# Altium schematic sheet ETH.SchDoc
size A3; DocumentNumber: 6; SheetNumber: 6; SheetTotal: 12
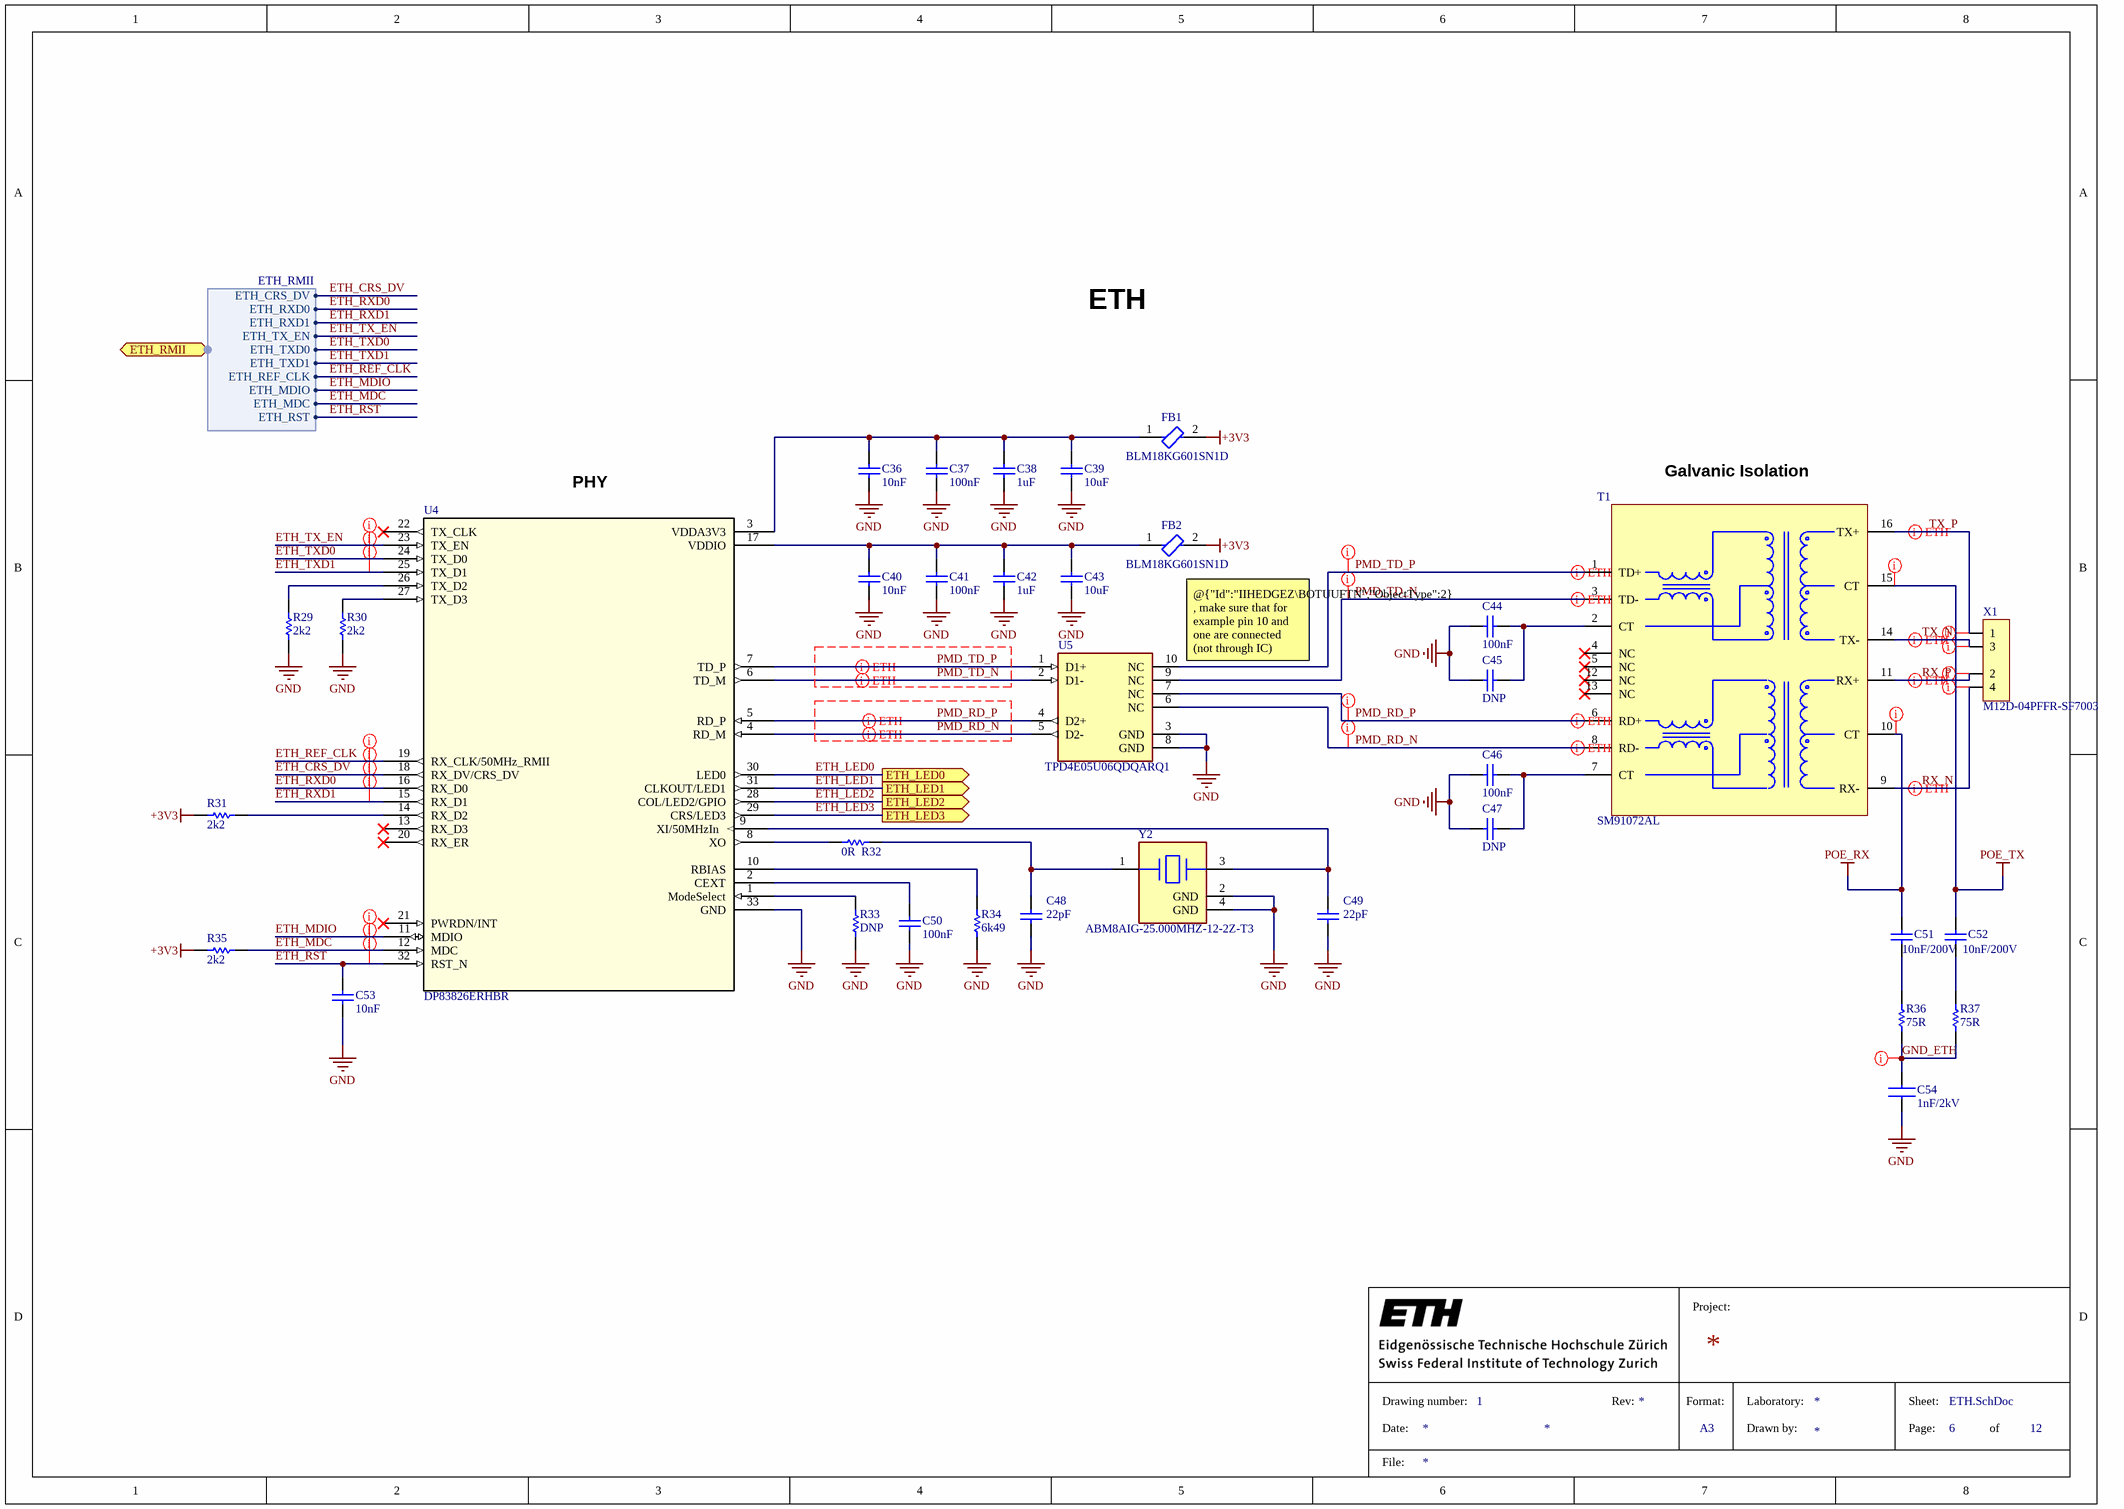
[diagram p0: ETH.SchDoc]

## Parts
C36  10nF  [GRM15x]
C37  100nF  [CAPC1005X55X25LL05T10]
C38  1uF  [CAPC1005X70N]
C39  10uF  [GRM15x]
C40  10nF  [GRM15x]
C41  100nF  [CAPC1005X55X25LL05T10]
C42  1uF  [CAPC1005X70N]
C43  10uF  [GRM15x]
C44  100nF  [CAPC1005X55X25LL05T10]
C45  DNP  [CAPC1005X55X25LL05T10]
C46  100nF  [CAPC1005X55X25LL05T10]
C47  DNP  [CAPC1005X55X25LL05T10]
C48  22pF  [C0402C104J4RACTU]
C49  22pF  [C0402C104J4RACTU]
C50  100nF  [CAPC1005X55X25LL05T10]
C51  10nF/200V  [CAPC0603(1608)100_L]
C52  10nF/200V  [CAPC0603(1608)100_L]
C53  10nF  [GRM15x]
C54  1nF/2kV  [CAPC3216X180N]
FB1  BLM18KG601SN1D  [FP-BLM18-0_15-t0_8-IPC_A]
FB2  BLM18KG601SN1D  [FP-BLM18-0_15-t0_8-IPC_A]
R29  2k2  [RESC2013X60X40LL20T25]
R30  2k2  [RESC2013X60X40LL20T25]
R31  2k2  [RESC2013X60X40LL20T25]
R32  0R  [RESC1005X40X25NL05T10]
R33  DNP  [RESC1005X40X25NL05T10]
R34  6k49  [RESC1005X40X25NL05T05]
R35  2k2  [RESC2013X60X40LL20T25]
R36  75R  [RESC2013X60X40NL20T25]
R37  75R  [RESC2013X60X40NL20T25]
T1  SM91072AL  [SOIC127P950X590-16N]
U4  DP83826ERHBR  [QFN_ERHBR_TEX]
U5  TPD4E05U06QDQARQ1  [FP-DQA0010A-MFG]
X1  M12D-04PFFR-SF7003  [M12D04PFFRSF7003]
Y2  ABM8AIG-25.000MHZ-12-2Z-T3  [FP-ABM8AIG-MFG]

## Ports
ETH_LED0 (out, see MAIN[3C], IndicatorLEDs[1A]), ETH_LED1 (out, see MAIN[3C], IndicatorLEDs[1A]), ETH_LED2 (out, see MAIN[3C], IndicatorLEDs[1B]), ETH_LED3 (out, see MAIN[3C], IndicatorLEDs[1B]), ETH_RMII (bidir, harness ETH_RMII, see MAIN[3C], MCU[1A])

## Harnesses
ETH_RMII: ETH_REF_CLK, ETH_MDIO, ETH_MDC, ETH_CRS_DV, ETH_TX_EN, ETH_RXD0, ETH_RXD1, ETH_TXD0, ETH_TXD1, ETH_RST

## Nets
+3V3: FB1.2 FB2.2 R31.1 R35.2
GND: C36.1 C37.1 C38.1 C39.1 C40.1 C41.1 C42.1 C43.1 C44.1 C45.1 C46.1 C47.1 C48.1 C49.1 C50.1 C53.1 C54.1 R29.1 R30.1 R33.1 R34.1 U4.33(GND) U5.3(GND) U5.8(GND) Y2.2(GND) Y2.4(GND)
POE_RX: C51.1 T1.10(CT)
POE_TX: C52.1 T1.15(CT)
ETH_CRS_DV: U4.18(RX_DV/CRS_DV) ; port ETH_RMII.ETH_CRS_DV
ETH_LED0: U4.30(LED0) ; port ETH_LED0
ETH_LED1: U4.31(CLKOUT/LED1) ; port ETH_LED1
ETH_LED2: U4.28(COL/LED2/GPIO) ; port ETH_LED2
ETH_LED3: U4.29(CRS/LED3) ; port ETH_LED3
ETH_MDC: R35.1 U4.12(MDC) ; port ETH_RMII.ETH_MDC
ETH_MDIO: U4.11(MDIO) ; port ETH_RMII.ETH_MDIO
ETH_REF_CLK: U4.19(RX_CLK/50MHz_RMII) ; port ETH_RMII.ETH_REF_CLK
ETH_RST: C53.2 U4.32(RST_N) ; port ETH_RMII.ETH_RST
ETH_RXD0: U4.16(RX_D0) ; port ETH_RMII.ETH_RXD0
ETH_RXD1: U4.15(RX_D1) ; port ETH_RMII.ETH_RXD1
ETH_TX_EN: U4.23(TX_EN) ; port ETH_RMII.ETH_TX_EN
ETH_TXD0: U4.24(TX_D0) ; port ETH_RMII.ETH_TXD0
ETH_TXD1: U4.25(TX_D1) ; port ETH_RMII.ETH_TXD1
GND_ETH: C54.2 R36.1 R37.1
PMD_RD_N: T1.8(RD-) U4.4(RD_M) U5.5(D2-) U5.6(NC)
PMD_RD_P: T1.6(RD+) U4.5(RD_P) U5.4(D2+) U5.7(NC)
PMD_TD_N: T1.3(TD-) U4.6(TD_M) U5.2(D1-) U5.9(NC)
PMD_TD_P: T1.1(TD+) U4.7(TD_P) U5.1(D1+) U5.10(NC)
RX_N: T1.9(RX-) X1.4
RX_P: T1.11(RX+) X1.2
TX_N: T1.14(TX-) X1.3
TX_P: T1.16(TX+) X1.1
NetC36_2: C36.2 C37.2 C38.2 C39.2 FB1.1 U4.3(VDDA3V3)
NetC40_2: C40.2 C41.2 C42.2 C43.2 FB2.1 U4.17(VDDIO)
NetC44_2: C44.2 C45.2 T1.2(CT)
NetC46_2: C46.2 C47.2 T1.7(CT)
NetC48_2: C48.2 R32.2 Y2.1
NetC49_2: C49.2 U4.9(XI/50MHzIn) Y2.3
NetC50_2: C50.2 U4.2(CEXT)
NetC51_2: C51.2 R36.2
NetC52_2: C52.2 R37.2
NetR29_2: R29.2 U4.26(TX_D2)
NetR30_2: R30.2 U4.27(TX_D3)
NetR31_2: R31.2 U4.14(RX_D2)
NetR32_1: R32.1 U4.8(XO)
NetR33_2: R33.2 U4.1(ModeSelect)
NetR34_2: R34.2 U4.10(RBIAS)

Not connected (* = marked no-connect by the designer): T1 4(NC)* 5(NC)* 12(NC)* 13(NC)*; U4 13(RX_D3)* 20(RX_ER)* 21(PWRDN/INT)* 22(TX_CLK)*

## Layout directives
differential pair; differential pair class ETH_100R_isolated; rule Matched Net Lengths [Tolerance = 100mil]: RX_N, RX_P, TX_N, TX_P
net class ETH_isolated: GND_ETH, POE_RX, POE_TX, RX_N, RX_P, TX_N, TX_P
net class ETH: PMD_RD_N, PMD_RD_P, PMD_TD_N, PMD_TD_P
differential pair; differential pair class ETH_100R; rule Matched Net Lengths [Tolerance = 100mil]: PMD_RD_N, PMD_RD_P, PMD_TD_N, PMD_TD_P
differential pair; differential pair class ETH_100R; net class ETH_100R; rule Matched Net Lengths [Tolerance = 100mil]: PMD_RD_N, PMD_RD_P, PMD_TD_N, PMD_TD_P
net class 50RNetsClass: ETH_CRS_DV, ETH_MDC, ETH_MDIO, ETH_REF_CLK, ETH_RST, ETH_RXD0, ETH_RXD1, ETH_TX_EN, ETH_TXD0, ETH_TXD1

## Notes on the sheet
- ETH
- (near U4) PHY
- (near T1) Galvanic Isolation
- @{"Id":"IIHEDGEZ\BOTUUFTN","ObjectType":2} , make sure that for example pin 10 and one are connected (not through IC)
- Project:
- Drawing number:
- Date:
- 1
- Rev:
- Format:
- A3
- Laboratory:
- Drawn by:
- Sheet:
- Page:
- of
- File:

## Library data of the parts
C36 C40 C53 = GRM155R71H103KA88D: Capacitor 10nF/50V 0402 - storage; Manufacturer_Name: Murata Electronics; Datasheet Link: https://search.murata.co.jp/Ceramy/image/img/A01X/G101/ENG/GRM155R71H103KA88-01A.pdf; Height: 0.33mm; Manufacturer Part Number: GRM155R71H103KA88D; Mouser Part Number: 81-GRM155R71H103KA8D; Mouser Price/Stock: https://www.mouser.co.uk/ProductDetail/Murata-Electronics/GRM155R71H103KA88D?qs=Dfh4SrgScWxOVlCuzd3ZyQ%3D%3D; Arrow Part Number: GRM155R71H103KA88D; Arrow Price/Stock: https://www.arrow.com/en/products/grm155r71h103ka88d/murata-manufacturing?utm_currency=USD&region=nac
C37 C41 C44-C47 C50 = GRM155R71H104KE14J: Capacitor 100nF 0402 - storage; Manufacturer: Murata; Tolerance: 10%; Dielectric: X7R; Voltage Rating (DC): 50V; Supplier 1: Digi-Key; Manufacturer Part Number: GRM155R71H104KE14J; RoHS: Yes; Category: Ceramic Capacitors; Stock 1: 1916144; Pricing 1: 1=0.10000, 10=0.03800, 100=0.01680, 500=0.01198, 1000=0.00941, 2500=0.00855, 5000=0.00787 (USD); Mount: Surface Mount; Case/Package: 0402; Weight: 0.000212oz; Case Code (Imperial): 0402; Case Code (Metric): 1005; Min Operating Temperature: -55°C; Max Operating Temperature: 125°C; Termination: SMD/SMT; Composition: Ceramic; Package Quantity: 50000; Packaging: Tape and Reel; Value: 100nF; Voltage Rating: 50V; Length: 0.039inch; Height: 0.5mm; Width: 0.5mm; Thickness: 0.022inch; Lead Free: Lead Free; ComponentLink1URL: http://search.murata.co.jp/Ceramy/image/img/A01X/G101/ENG/GRM155R71H104KE14-01.pdf?src-supplier=Mouser; ComponentLink1Description: http://search.murata.co.jp/Ceramy/image/img/A01X/G101/ENG/GRM155R71H104KE14-01.pdf?src-supplier=Mouser; ComponentLink2URL: http://search.murata.co.jp/Ceramy/image/img/A01X/G101/ENG/GRM155R71H104KE14-01.pdf?src-supplier=Digi-Key; ComponentLink2Description: http://search.murata.co.jp/Ceramy/image/img/A01X/G101/ENG/GRM155R71H104KE14-01.pdf?src-supplier=Digi-Key; ComponentLink3URL: http://search.murata.co.jp/Ceramy/image/img/A01X/G101/ENG/GRM155R71H104KE14-01.pdf?src-supplier=Avnet; ComponentLink3Description: http://search.murata.co.jp/Ceramy/image/img/A01X/G101/ENG/GRM155R71H104KE14-01.pdf?src-supplier=Avnet; ComponentLink4URL: http://search.murata.co.jp/Ceramy/image/img/A01X/G101/ENG/GRM155R71H104KE14-01.pdf?src-supplier=Avnet+Europe; ComponentLink4Description: http://search.murata.co.jp/Ceramy/image/img/A01X/G101/ENG/GRM155R71H104KE14-01.pdf?src-supplier=Avnet+Europe; Supplier Part Number 1: 490-13342-1-ND
C38 C42 = GRM155R6YA105KE11D: Capacitor 1uF/35V 0402 - storage; Manufacturer_Name: Murata Electronics; Datasheet Link: https://search.murata.co.jp/Ceramy/image/img/A01X/G101/ENG/GRM155R6YA105KE11-01A.pdf; Height: 0.7mm; Manufacturer Part Number: GRM155R6YA105KE11D; Mouser Part Number: 81-GRM155R6YA105KE1D; Mouser Price/Stock: https://www.mouser.co.uk/ProductDetail/Murata-Electronics/GRM155R6YA105KE11D?qs=hNud%2FORuBR1Z%2F4J6kBsCGQ%3D%3D; Arrow Part Number: GRM155R6YA105KE11D; Arrow Price/Stock: https://www.arrow.com/en/products/grm155r6ya105ke11d/murata-manufacturing?region=europe
C39 C43 = GRM155R61A106ME11D: Capacitor 10uF 0402 - storage; Manufacturer_Name: Murata Electronics; Datasheet Link: https://search.murata.co.jp/Ceramy/image/img/A01X/G101/ENG/GRM155R61A106ME11-01A.pdf; Height: 0.33mm; Manufacturer Part Number: GRM155R61A106ME11D; Mouser Part Number: 81-GRM155R61A106ME1D; Mouser Price/Stock: https://www.mouser.co.uk/ProductDetail/Murata-Electronics/GRM155R61A106ME11D?qs=xZ%2FP%252Ba9zWqZMJSi57Q8OyA%3D%3D; Arrow Part Number: GRM155R61A106ME11D; Arrow Price/Stock: https://www.arrow.com/en/products/grm155r61a106me11d/murata-manufacturing?utm_currency=USD&region=nac
C48 C49 = C0402C220K5GACTU: Capacitor 22pF 0402; Manufacturer_Name: KEMET; Datasheet Link: https://content.kemet.com/datasheets/KEM_C1002_X7R_SMD.pdf; Height: 0.55mm; Manufacturer Part Number: C0402C220K5GACTU; Mouser Part Number: 80-C0402C220K5G; Mouser Price/Stock: https://www.mouser.co.uk/ProductDetail/KEMET/C0402C220K5GACTU?qs=6dm3P68XlMDqaWSnHxY69A%3D%3D; Arrow Part Number: C0402C220K5GACTU; Arrow Price/Stock: https://www.arrow.com/en/products/c0402c220k5gactu/kemet-corporation?region=nac
C51 C52 = CMP-1035-02328-1: CAP 10nF 200V ±10% 0603 (1608 Metric) Thickness 1mm SMD; Manufacturer Part Number: C0603C103K2RAC; Manufacturer: Yageo Group; Case-Metric: 1608; Tolerance: Â±10%; Case-EIA: 0603; Technology: SMT; Rated Voltage: 200 V; Value: 10nF; Max Thickness: 1 mm
C54 = CL31B102KJHNNNE: Capacitor 1nF/2kV 3216 Isolated GND Loop Cap; Manufacturer_Name: SAMSUNG; Datasheet Link: https://www.tme.com/Document/4a42202b32dab16128fe107dd69598cc/samsung-chip-cap.pdf; Height: 1.8mm; Manufacturer Part Number: CL31B102KJHNNNE; Mouser Part Number: 187-CL31B102KJHNNNE; Mouser Price/Stock: https://www.mouser.co.uk/ProductDetail/Samsung-Electro-Mechanics/CL31B102KJHNNNE?qs=X6jEic%2FHinAYVHtIjHgytw%3D%3D; Arrow Part Number: CL31B102KJHNNNE; Arrow Price/Stock: https://www.arrow.com/en/products/cl31b102kjhnnne/samsung-electro-mechanics?utm_currency=USD&region=nac; Supplier 1: DigiKey; Supplier Part Number 1: 1276-3073-1-ND
FB1 FB2 = CMP-0686-00581-3: Chip Ferrite Bead, 0603, 600Ω @ 100MHz, 0.15Ω, 25%, 1.3A; Material: Steel; Number of Lines: 1; Impedance: 600R; DC Resistance (DCR): 150mR; Tolerance: 25%; Case Code (Metric): 1608; Width: 0.8mm; DC Current: 1.3A; Max DC Current: 1.3A; Package Quantity: 1; Number of Pins: 2; Military Standard: Not; RoHS Compliant: Yes; Termination: SMD/SMT; Max Operating Temperature: 125°C; Length: 1.6mm; Depth: 0.8mm; Case Code (Imperial): 0603; Series: BLM18K; Inductor Type: FERRITE BEAD; Core Material: Ferrite; Number of Circuits: 1; Height: 0.8mm; Case/Package: 0603; REACH SVHC: No SVHC; Packaging: Tape and Reel; Min Operating Temperature: -55°C; Max Current Rating: 1.3A; Radiation Hardening: No; Current Rating: 1.3A; Lead Free: Lead Free; Test Frequency: 100MHz; Weight: 7.1E-05oz; Manufacturer Part Number: BLM18KG601SN1D; Supplier 1: Digikey; Supplier Part Number 1: 490-5258-1-ND
R29-R31 R35 = CMP-2001-00613-1: Resistor 2k2 0603; Manufacturer: Panasonic; Manufacturer Part Number: ERA6AEB222V; Supplier 1: Mouser; Supplier Part Number 1: 603-RC0603FR-072K2L
R32 R33 = CMP-009-00183-1: Resistor 0R 0402; Manufacturer: Vishay Dale; Manufacturer Part Number: CRCW04020000Z0EDHP; Power: 200mW; Min Operating Temperature: -55°C; Pins: 2; Case/Package: 0402; Mounting Technology: Surface Mount; Max Operating Temperature: 155°C; RoHS Compliant: Yes; Component Type: Resistors; Supplier 1: Digikey; Supplier Part Number 1: 541-0.0YBCT-ND
  R32: Value: 0R
  R33: Value: DNP
R34 = CMP-2002-00186-1: Resistor 6k49 0402 1%; Manufacturer: Vishay Dale; Manufacturer Part Number: CRCW04026K49FKED; Supplier 1: Mouser; Supplier Part Number 1: 71-CRCW0402-6.49K-E3
R36 R37 = CMP-2001-00665-1: Resistor 75R 0805; Part Number: ERA6AEB750V; Manufacturer Part Number: ERA6AEB750V; Supplier 1: Mouser; Supplier Part Number 1: 667-ERA-6AEB750V
T1 = SM91072AL: Telecom Transformer 1: 1 1.4Ohm Prim. DCR 1Ohm Sec. DCR 16 Terminal Gull Wing SMD Automotive; Manufacturer: Bourns; Value: 350uH; Turns Ratio: 1:1; ComponentLink1URL: http://www.farnell.com/datasheets/2169310.pdf?src-supplier=Farnell; ComponentLink1Description: http://www.farnell.com/datasheets/2169310.pdf?src-supplier=Farnell; ComponentLink2URL: https://www.bourns.com/docs/Product-Datasheets/sm13072apel.pdf?src-supplier=Digi-Key; ComponentLink2Description: https://www.bourns.com/docs/Product-Datasheets/sm13072apel.pdf?src-supplier=Digi-Key; ComponentLink3URL: http://www.farnell.com/datasheets/2169310.pdf?src-supplier=Newark; ComponentLink3Description: http://www.farnell.com/datasheets/2169310.pdf?src-supplier=Newark; Supplier: Digikey; Supplier Part Number: 118-SM91072AL-ECT-ND; Manufacturer Part Number: SM91072AL; RoHS: Yes; Category: Uncategorized; Stock: 2173; Pricing: 1=4.72, 10=3.828, 25=3.0952, 50=2.8998, 100=2.7695, 250=2.68808 (USD); Mounting Technology: Surface Mount; Min Operating Temperature: -40°C; Max Operating Temperature: 125°C; Series: Automotive, AEC-Q200, SM; Supplier 1: Digikey; Supplier Part Number 1: 118-SM91072AL-ECT-ND
U4 = DP83826ERHBR: Ethernet Transceiver, 1-Trnsvr, PQCC32; Manufacturer: Texas Instruments; Supplier: Digikey; Supplier Part Number: 296-DP83826ERHBRCT-ND; Manufacturer Part Number: DP83826ERHBR; RoHS: Yes; Category: Ethernet Interface ICs; Stock: 2127; Pricing: 1=3.1, 10=2.321, 25=2.1264, 100=1.9128, 250=1.81096, 500=1.74958, 1000=1.69905 (USD); ComponentLink1URL: https://www.ti.com:443/lit/ds/symlink/dp83826e.pdf?src-supplier=IHS+Markit; ComponentLink1Description: https://www.ti.com:443/lit/ds/symlink/dp83826e.pdf?src-supplier=IHS+Markit; ComponentLink2URL: http://www.ti.com/general/docs/suppproductinfo.tsp?distId=10&amp;gotoUrl=http%3A%2F%2Fwww.ti.com%2Flit%2Fgpn%2Fdp83826e&src-supplier=Digikey; ComponentLink2Description: http://www.ti.com/general/docs/suppproductinfo.tsp?distId=10&amp;gotoUrl=http%3A%2F%2Fwww.ti.com%2Flit%2Fgpn%2Fdp83826e&src-supplier=Digikey; Supplier 1: Mouser; Supplier Part Number 1: 595-DP83826ERHBR; Supplier 2: Digikey; Supplier Part Number 2: 296-DP83826ERHBRCT-ND
U5 = CMP-04985-000004-1: TVS DIODE 5.5V 14V 10USON; Manufacturer: Texas Instruments; Direction: Unidirectional; Standoff Height: 0mm; Capacitance: 0.5pF; Number Of Channels: 4; Breakdown Voltage: 6.4V; Peak Pulse Power: 2.5W; Automotive Grade: Grade 1; Value: 0.5pF; Interface: USB,Ethernet,LVDS,Other; Peak Pulse Current: 2.5A; Operating Supply Voltage: 5.5V; Reverse Standoff Voltage: 5.5V; Package: DQA0010A; Temperature Range Low: -40°C; Temperature Range High: +125°C; Ambient Temperature Range Low: -40°C; Device Class L1: Circuit Protection; Clamping Voltage: 14V; Manufacturer Part Number: TPD4E05U06QDQARQ1; Device Class L2: ESD and Circuit Protection ICs; Octopart: https://octopart.com/tpd4e05u06qdqarq1-texas+instruments-48523459; Device Class L3: unset; Height: 0.55mm; Automotive: Yes; ComponentLink2Description: Datasheet; RoHS: TRUE; Ambient Temperature Range High: +125°C; Category: IC; Mouser Description: Automotive 4-Channel ESD Protection Solution for SuperSpeed (up to 5 Gbps) Interface 10-USON -40 to 125; Temperature: -40°C to +125°C; ComponentLink2URL: http://www.ti.com/lit/ds/symlink/tpd4e05u06-q1.pdf; Digikey Description: TVS DIODE 5.5V 14V 10USON; Lead Free: Yes
X1 = M12D-04PFFR-SF7003: Conn Circular F 4 POS Solder RA Panel Mount 4 Terminal 1 Port; Manufacturer: Amphenol; Manufacturer Part Number: M12D-04PFFR-SF7003; RoHS: No; Pricing 1: 10=8.15600 (USD); ComponentLink1URL: http://www.amphenolltw.com/2012download/2D%20PDF/03_M%20Series%20Sensor%20Connectors/M12D-04PFFR-SF7003.pdf?src-supplier=Digi-Key; ComponentLink1Description: http://www.amphenolltw.com/2012download/2D%20PDF/03_M%20Series%20Sensor%20Connectors/M12D-04PFFR-SF7003.pdf?src-supplier=Digi-Key; Supplier 1: Digikey; Supplier Part Number 1: 4995-M12D-04PFFR-SF7003-ND
Y2 = CMP-27762-004325-2: Crystal 25MHz ±20ppm (Tol) ±50ppm (Stability) 12pF FUND 50Ω Automotive 4-Pin Ultra Mini-CSMD T/R; ESR (Equivalent Series Resistance): 50R; Load Capacitance: 12pF; Ratings: AEC-Q200; Frequency: 25MHz; Packaging: Cut Tape; Frequency Stability: 50ppm; Series: ABM8AIG; RoHS Compliant: Yes; Height: 0.031inch; Width: 0.098inch; Mount: Surface Mount; Length: 0.126inch; Frequency Tolerance: 20ppm; Min Operating Temperature: -40°C; Case/Package: SMD/SMT; Max Operating Temperature: 125°C; Manufacturer Part Number: ABM8AIG-25.000MHZ-12-2Z-T3